# Altium project buck_conv.PrjPcb
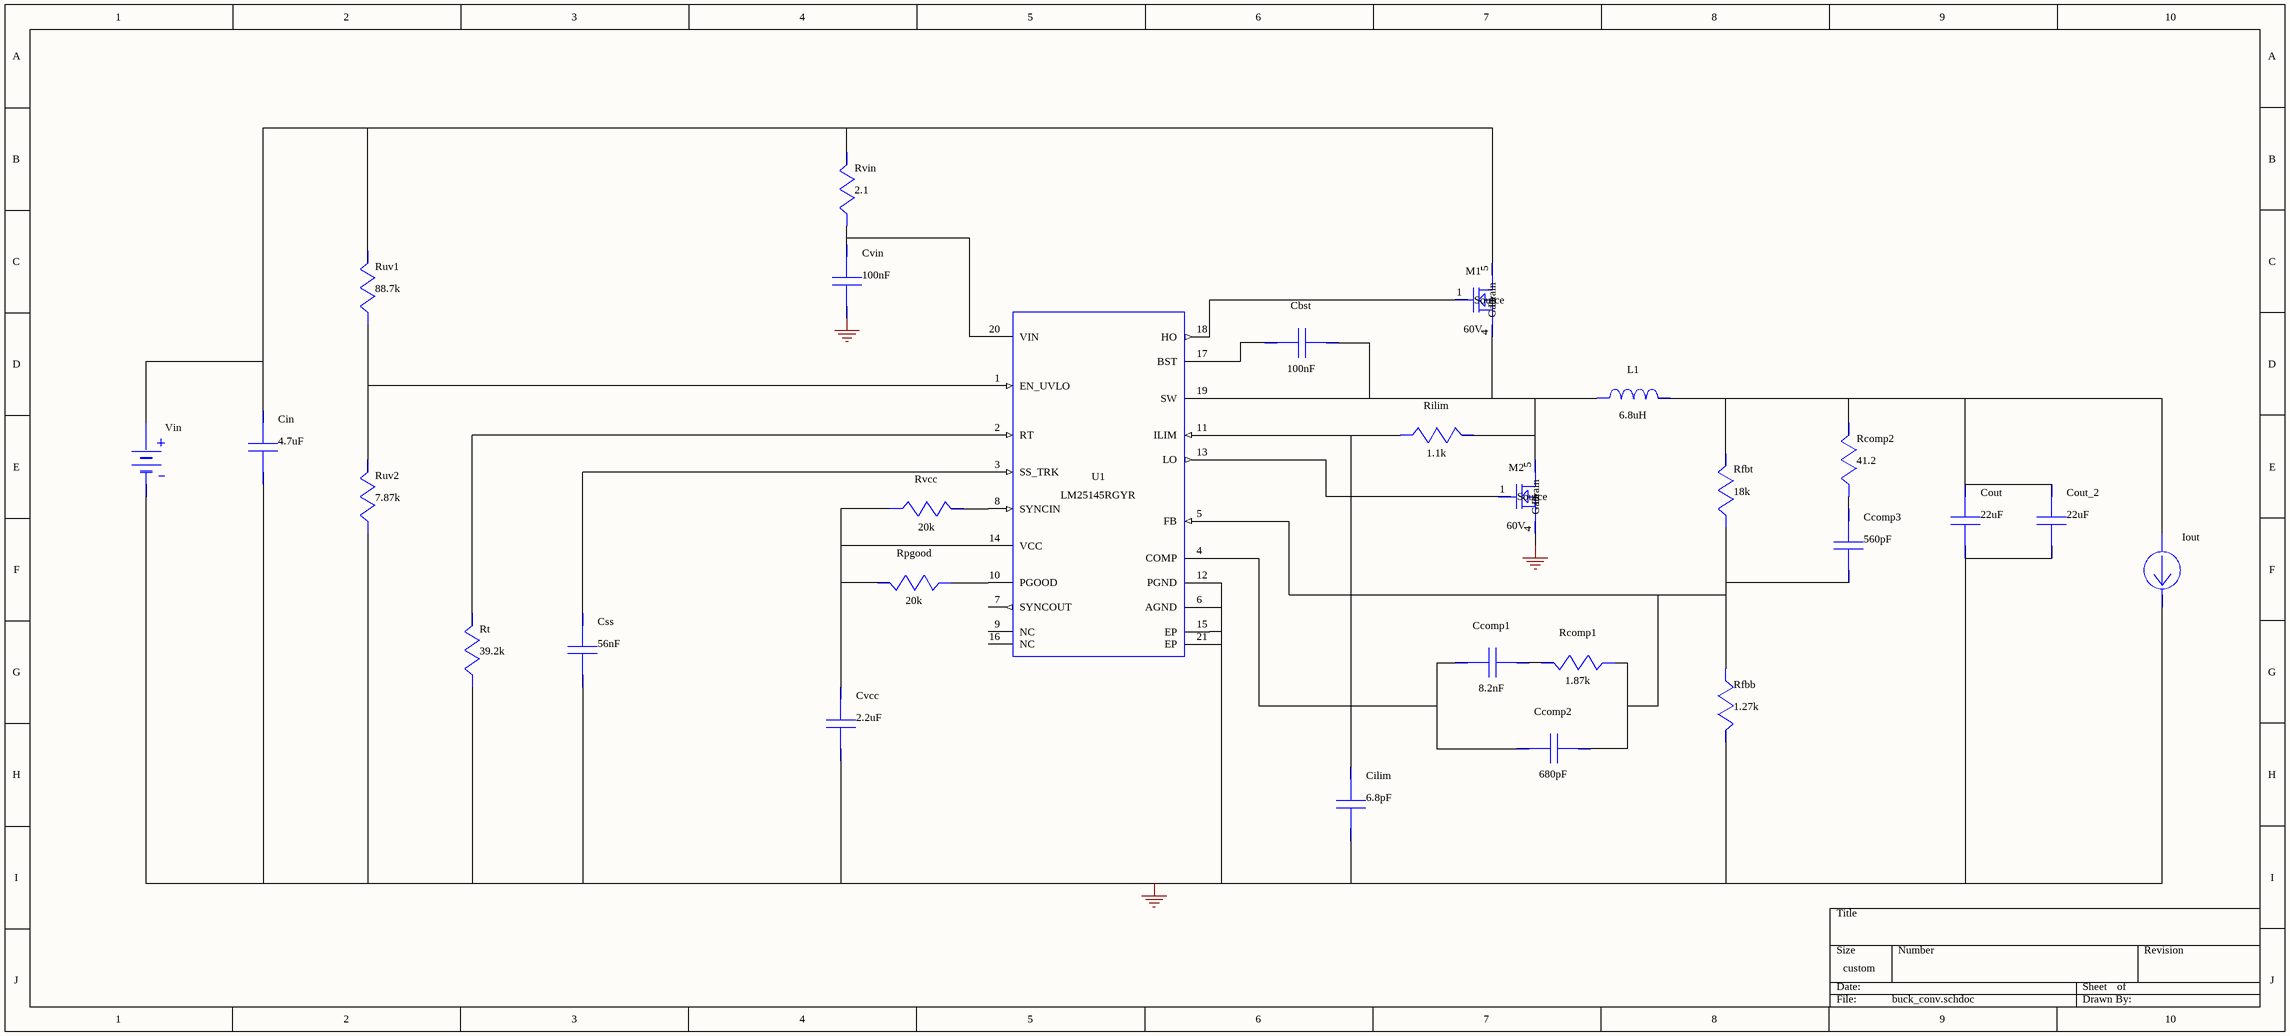
[diagram p0: buck_conv.schdoc]
1 sheet, 28 parts. Net scope: global (net labels, ports and power ports of the same name join across sheets).
Board file: buck_conv.PcbDoc

## Sheet buck_conv.schdoc
size 471 x 212 mm; SheetNumber: 1; SheetTotal: 1

### Parts
Cbst  value 100nF  (hidden comment: CGA3E2X7R1H104K080AA)
Ccomp1  value 8.2nF  (hidden comment: GRM155R71C822KA01D)
Ccomp2  value 680pF  (hidden comment: CGA2B2X7R1H681K050BA)
Ccomp3  value 560pF  (hidden comment: GRM155R71H561KA01D)
Cilim  value 6.8pF  (hidden comment: 06031U6R8BAT2A)
Cin  value 4.7uF  (hidden comment: MSASU32MSB7475MPNA01)
Cout  value 22uF  (hidden comment: MSAST32MSB7226KPNB25)
Cout_2  value 22uF  (hidden comment: MSAST32MSB7226KPNB25)
Css  value 56nF  (hidden comment: GRM155R71C563KA88D)
Cvcc  value 2.2uF  (hidden comment: CGA5L2X7R1E225K160AA)
Cvin  value 100nF  (hidden comment: CGA3E2X7R1H104K080AA)
Iout  WB_CURRENT_LOAD  (value not drawn)
L1  value 6.8uH  (hidden comment: SRP1270-6R8M)
M1  value 60V  (hidden comment: CSD18543Q3A)
M2  value 60V  (hidden comment: CSD18543Q3A)
Rcomp1  value 1.87k  (hidden comment: CRCW04021K87FKED)
Rcomp2  value 41.2  (hidden comment: CRCW040241R2FKED)
Rfbb  value 1.27k  (hidden comment: CRCW04021K27FKED)
Rfbt  value 18k  (hidden comment: RC0603FR-0718KL)
Rilim  value 1.1k  (hidden comment: CRCW04021K10FKED)
Rpgood  value 20k  (hidden comment: RC0603FR-0720KL)
Rt  value 39.2k  (hidden comment: CRCW040239K2FKED)
Ruv1  value 88.7k  (hidden comment: CRCW040288K7FKED)
Ruv2  value 7.87k  (hidden comment: RC0603FR-077K87L)
Rvcc  value 20k  (hidden comment: RC0603FR-0720KL)
Rvin  value 2.1  (hidden comment: CRCW06032R10FKEA)
U1  LM25145RGYR
Vin  WB_BATTERY  (value not drawn)

### Nets
0: Cilim.1 Cin.2 Cout.2 Cout_2.2 Css.2 Cvcc.2 Cvin.2 Iout.2(-) M2.4(Gate) Rfbb.1 Rt.2 Ruv2.2 U1.6(AGND) U1.12(PGND) U1.15(EP) U1.21(EP) Vin.2(-)
NetCbst_1: Cbst.1 U1.17(BST)
NetCbst_2: Cbst.2 L1.2 M1.4(Gate) M2.5(Drain) M2.6(Drain) M2.7(Drain) M2.8(Drain) M2.9(Drain) Rilim.1 U1.19(SW)
NetCcomp1_1: Ccomp1.1 Ccomp2.1 U1.4(COMP)
NetCcomp1_2: Ccomp1.2 Rcomp1.1
NetCcomp2_2: Ccomp2.2 Ccomp3.2 Rcomp1.2 Rfbb.2 Rfbt.2 U1.5(FB)
NetCcomp3_1: Ccomp3.1 Rcomp2.2
NetCilim_2: Cilim.2 Rilim.2 U1.11(ILIM)
NetCin_1: Cin.1 M1.5(Drain) M1.6(Drain) M1.7(Drain) M1.8(Drain) M1.9(Drain) Ruv1.1 Rvin.1 Vin.1(+)
NetCout_1: Cout.1 Cout_2.1 Iout.1(+) L1.1 Rcomp2.1 Rfbt.1
NetCss_1: Css.1 U1.3(SS_TRK)
NetCvcc_1: Cvcc.1 Rpgood.1 Rvcc.2 U1.14(VCC)
NetCvin_1: Cvin.1 Rvin.2 U1.20(VIN)
NetM1_1: M1.1(Source) M1.2(Source) M1.3(Source) U1.18(HO)
NetM2_1: M2.1(Source) M2.2(Source) M2.3(Source) U1.13(LO)
NetRpgood_2: Rpgood.2 U1.10(PGOOD)
NetRt_1: Rt.1 U1.2(RT)
NetRuv1_2: Ruv1.2 Ruv2.1 U1.1(EN_UVLO)
NetRvcc_1: Rvcc.1 U1.8(SYNCIN)

Not connected (* = marked no-connect by the designer): U1 7(SYNCOUT) 9(NC) 16(NC)

### Library data of the parts
Cbst Cvin = CGA3E2X7R1H104K080AA: CGA3E2X7R1H104K0; Manufacturer Name: TDK; PackageReference: CGA3E2X7R1H104K080AA; Manufacturer Part Number: CGA3E2X7R1H104K080AA
Ccomp1 = GRM155R71C822KA01D: GRM155R71C822KA0; Manufacturer Name: MuRata; PackageReference: GRM155R71C822KA01D; Manufacturer Part Number: GRM155R71C822KA01D
Ccomp2 = CGA2B2X7R1H681K050BA: CGA2B2X7R1H681K0; Manufacturer Name: TDK; PackageReference: CGA2B2X7R1H681K050BA; Manufacturer Part Number: CGA2B2X7R1H681K050BA
Ccomp3 = GRM155R71H561KA01D: GRM155R71H561KA0; Manufacturer Name: MuRata; PackageReference: GRM155R71H561KA01D; Manufacturer Part Number: GRM155R71H561KA01D
Cilim = 06031U6R8BAT2A: Manufacturer Name: AVX; PackageReference: 06031U6R8BAT2A; Manufacturer Part Number: 06031U6R8BAT2A
Cin = MSASU32MSB7475MPNA01: MSASU32MSB7475MP; Manufacturer Name: Taiyo Yuden; PackageReference: MSASU32MSB7475MPNA01; Manufacturer Part Number: MSASU32MSB7475MPNA01
Cout Cout_2 = MSAST32MSB7226KPNB25: MSAST32MSB7226KP; Manufacturer Name: Taiyo Yuden; PackageReference: MSAST32MSB7226KPNB25; Manufacturer Part Number: MSAST32MSB7226KPNB25
Css = GRM155R71C563KA88D: GRM155R71C563KA8; Manufacturer Name: MuRata; PackageReference: GRM155R71C563KA88D; Manufacturer Part Number: GRM155R71C563KA88D
Cvcc = CGA5L2X7R1E225K160AA: CGA5L2X7R1E225K1; Manufacturer Name: TDK; PackageReference: CGA5L2X7R1E225K160AA; Manufacturer Part Number: CGA5L2X7R1E225K160AA
L1 = SRP1270-6R8M: Manufacturer Name: Bourns; PackageReference: SRP1270-6R8M; Manufacturer Part Number: SRP1270-6R8M
M1 M2 = CSD18543Q3A: Manufacturer Name: Texas Instruments; PackageReference: CSD18543Q3A; Manufacturer Part Number: CSD18543Q3A
Rcomp1 = CRCW04021K87FKED: Manufacturer Name: Vishay-Dale; PackageReference: CRCW04021K87FKED; Manufacturer Part Number: CRCW04021K87FKED
Rcomp2 = CRCW040241R2FKED: Manufacturer Name: Vishay-Dale; PackageReference: CRCW040241R2FKED; Manufacturer Part Number: CRCW040241R2FKED
Rfbb = CRCW04021K27FKED: Manufacturer Name: Vishay-Dale; PackageReference: CRCW04021K27FKED; Manufacturer Part Number: CRCW04021K27FKED
Rfbt = RC0603FR-0718KL: Manufacturer Name: Yageo; PackageReference: RC0603FR-0718KL; Manufacturer Part Number: RC0603FR-0718KL
Rilim = CRCW04021K10FKED: Manufacturer Name: Vishay-Dale; PackageReference: CRCW04021K10FKED; Manufacturer Part Number: CRCW04021K10FKED
Rpgood Rvcc = RC0603FR-0720KL: Manufacturer Name: Yageo; PackageReference: RC0603FR-0720KL; Manufacturer Part Number: RC0603FR-0720KL
Rt = CRCW040239K2FKED: Manufacturer Name: Vishay-Dale; PackageReference: CRCW040239K2FKED; Manufacturer Part Number: CRCW040239K2FKED
Ruv1 = CRCW040288K7FKED: Manufacturer Name: Vishay-Dale; PackageReference: CRCW040288K7FKED; Manufacturer Part Number: CRCW040288K7FKED
Ruv2 = RC0603FR-077K87L: Manufacturer Name: Yageo; PackageReference: RC0603FR-077K87L; Manufacturer Part Number: RC0603FR-077K87L
Rvin = CRCW06032R10FKEA: Manufacturer Name: Vishay-Dale; PackageReference: CRCW06032R10FKEA; Manufacturer Part Number: CRCW06032R10FKEA
U1 = LM25145RGYR: Manufacturer Name: Texas Instruments; PackageReference: LM25145RGYR; Manufacturer Part Number: LM25145RGYR; Value: N/A
Iout = WB_CURRENT_LOAD: PackageReference: WB_CURRENT_LOAD; Manufacturer Part Number: WB_CURRENT_LOAD; Manufacturer Name: WB_CURRENT_LOAD; Value: N/A
Vin = WB_BATTERY: PackageReference: WB_BATTERY; Manufacturer Part Number: WB_BATTERY; Manufacturer Name: WB_BATTERY; Value: N/A